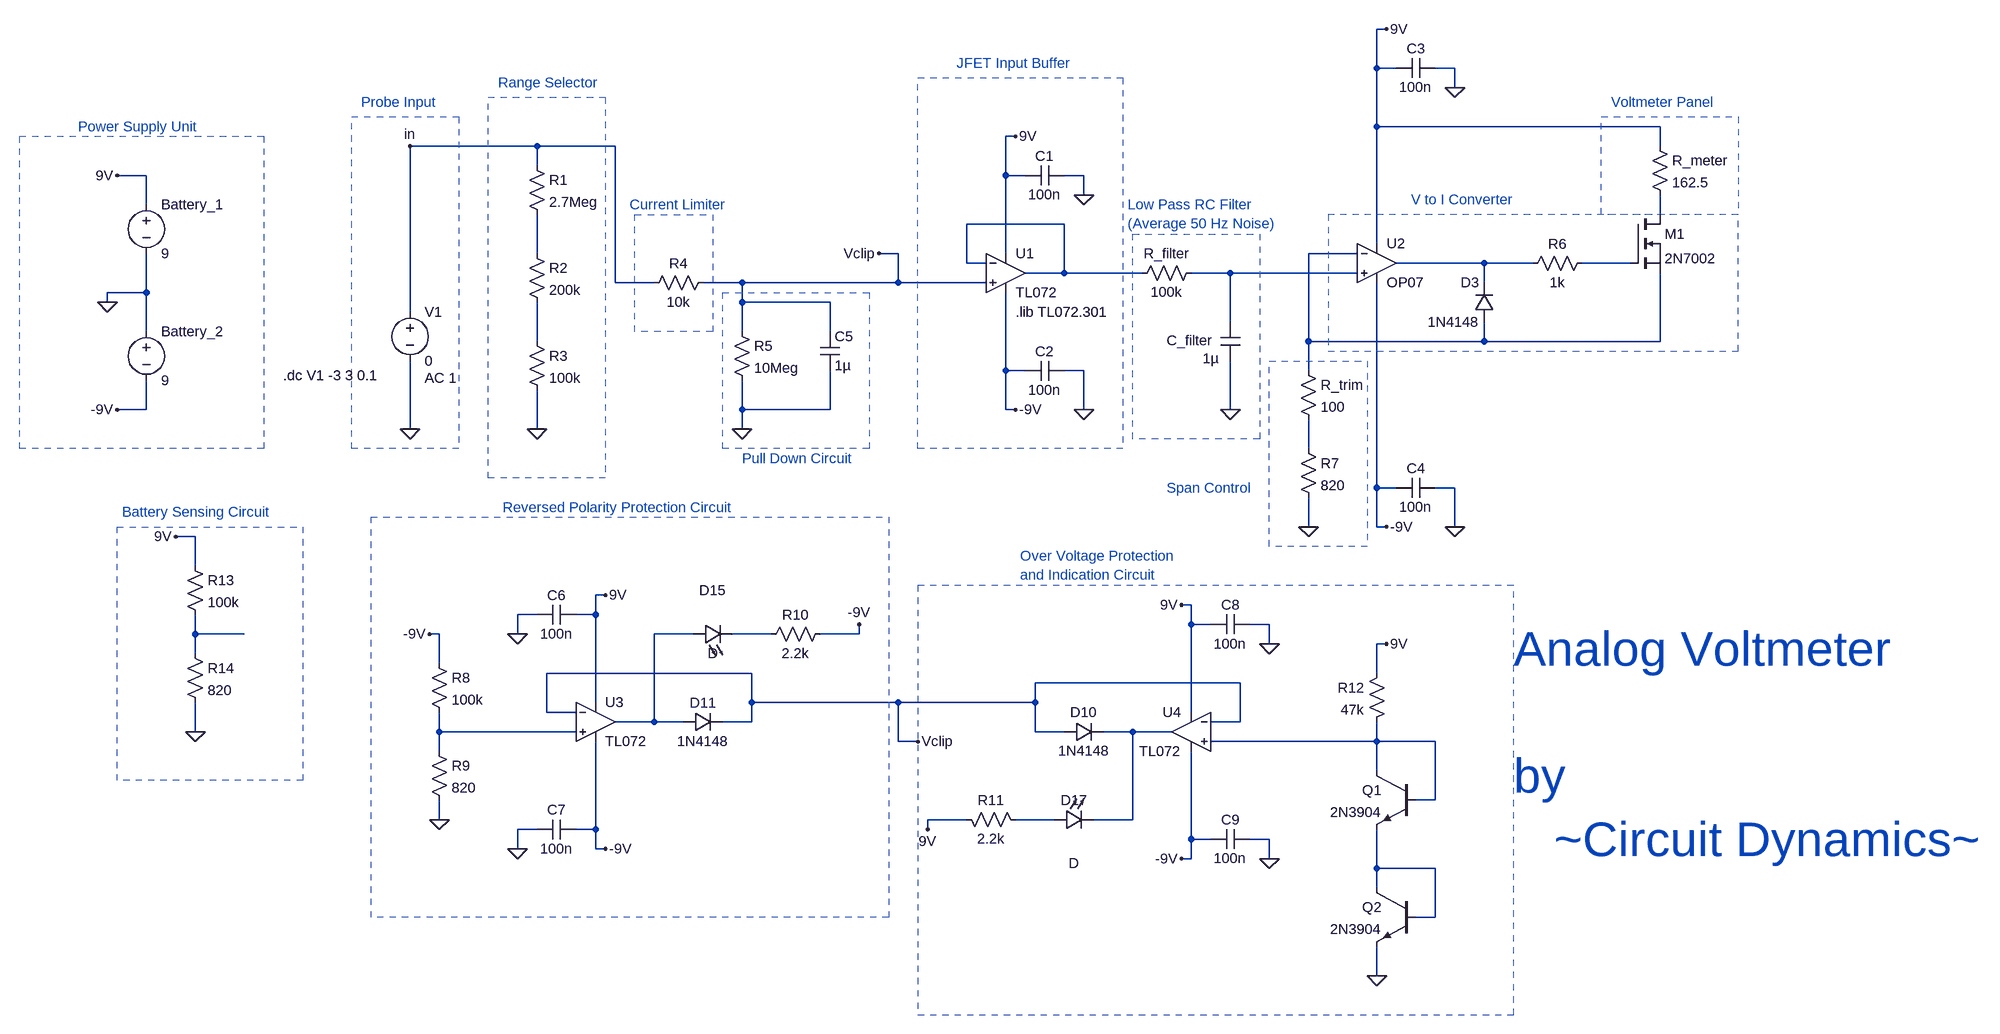
[diagram p0: schematic Analog_Voltmeter_Circuit.asc]
Analog_Voltmeter_Circuit.asc, the LTspice schematic file:
Version 4.1
SHEET 1 2912 2116
WIRE 1328 -272 1312 -272
WIRE 1312 -208 1312 -272
WIRE 1344 -208 1312 -208
WIRE 1440 -208 1408 -208
WIRE 1440 -176 1440 -208
WIRE 1312 -112 1312 -208
WIRE 1776 -112 1312 -112
WIRE 720 -96 704 -96
WIRE -64 -80 -272 -80
WIRE 64 -80 -64 -80
WIRE 1776 -80 1776 -112
WIRE -64 -48 -64 -80
WIRE -704 -32 -752 -32
WIRE 704 -32 704 -96
WIRE 736 -32 704 -32
WIRE 832 -32 800 -32
WIRE 832 0 832 -32
WIRE -704 16 -704 -32
WIRE 1776 32 1776 0
WIRE 800 48 640 48
WIRE 1312 80 1312 -112
WIRE -64 96 -64 32
WIRE 528 96 496 96
WIRE 704 96 704 -32
WIRE 1280 96 1200 96
WIRE 640 112 640 48
WIRE 672 112 640 112
WIRE 1488 112 1344 112
WIRE 1568 112 1488 112
WIRE 1728 112 1648 112
WIRE 800 128 800 48
WIRE 800 128 736 128
WIRE 928 128 800 128
WIRE 1072 128 1008 128
WIRE 1280 128 1072 128
WIRE 64 144 64 -80
WIRE 128 144 64 144
WIRE 272 144 208 144
WIRE 528 144 528 96
WIRE 528 144 272 144
WIRE 672 144 528 144
WIRE 1488 144 1488 112
WIRE -704 160 -704 96
WIRE -704 160 -768 160
WIRE -768 176 -768 160
WIRE 272 176 272 144
WIRE 416 176 272 176
WIRE -272 192 -272 -80
WIRE 1072 208 1072 128
WIRE -704 224 -704 160
WIRE 272 224 272 176
WIRE 416 224 416 176
WIRE -64 240 -64 176
WIRE 1200 240 1200 96
WIRE 1488 240 1488 208
WIRE 1488 240 1200 240
WIRE 1776 240 1776 128
WIRE 1776 240 1488 240
WIRE 704 288 704 160
WIRE 736 288 704 288
WIRE 832 288 800 288
WIRE 1200 288 1200 240
WIRE -704 352 -704 304
WIRE -704 352 -752 352
WIRE 272 352 272 304
WIRE 416 352 416 288
WIRE 416 352 272 352
WIRE 704 352 704 288
WIRE 720 352 704 352
WIRE 832 352 832 288
WIRE 1072 352 1072 272
WIRE -272 384 -272 272
WIRE -64 384 -64 320
WIRE 272 384 272 352
WIRE 1200 416 1200 368
WIRE 1312 480 1312 144
WIRE 1344 480 1312 480
WIRE 1440 480 1408 480
WIRE 1200 544 1200 496
WIRE 1312 544 1312 480
WIRE 1328 544 1312 544
WIRE 1440 544 1440 480
WIRE -624 560 -656 560
WIRE -624 608 -624 560
WIRE 48 656 32 656
WIRE 1008 672 992 672
WIRE -64 688 -96 688
WIRE 32 688 32 656
WIRE 32 688 0 688
WIRE 1008 704 1008 672
WIRE 1040 704 1008 704
WIRE 1136 704 1104 704
WIRE -624 720 -624 688
WIRE -544 720 -624 720
WIRE -224 720 -240 720
WIRE -96 720 -96 688
WIRE 192 720 128 720
WIRE 320 720 256 720
WIRE 464 720 464 704
WIRE 464 720 400 720
WIRE 1136 736 1136 704
WIRE 1328 736 1312 736
WIRE -624 752 -624 720
WIRE -224 768 -224 720
WIRE 288 784 -48 784
WIRE 1312 784 1312 736
WIRE 1088 800 752 800
WIRE 32 832 32 688
WIRE 288 832 288 784
WIRE 528 832 288 832
WIRE 752 832 752 800
WIRE 752 832 528 832
WIRE -48 848 -48 784
WIRE 0 848 -48 848
WIRE 1008 848 1008 704
WIRE 128 864 128 720
WIRE 128 864 64 864
WIRE 176 864 128 864
WIRE 288 864 288 832
WIRE 288 864 240 864
WIRE 1088 864 1088 800
WIRE 1088 864 1040 864
WIRE -624 880 -624 832
WIRE -224 880 -224 848
WIRE 0 880 -224 880
WIRE 752 880 752 832
WIRE 800 880 752 880
WIRE 912 880 864 880
WIRE 976 880 912 880
WIRE 528 896 528 832
WIRE 560 896 528 896
WIRE 1312 896 1312 864
WIRE 1312 896 1040 896
WIRE 1408 896 1312 896
WIRE -224 912 -224 880
WIRE 1312 944 1312 896
WIRE 1408 992 1408 896
WIRE 1408 992 1376 992
WIRE -224 1024 -224 992
WIRE 640 1024 576 1024
WIRE 784 1024 720 1024
WIRE 912 1024 912 880
WIRE 912 1024 848 1024
WIRE -64 1040 -96 1040
WIRE 32 1040 32 896
WIRE 32 1040 0 1040
WIRE 576 1040 576 1024
WIRE 1008 1056 1008 912
WIRE 1040 1056 1008 1056
WIRE 1136 1056 1104 1056
WIRE -96 1072 -96 1040
WIRE 32 1072 32 1040
WIRE 48 1072 32 1072
WIRE 1008 1088 1008 1056
WIRE 1008 1088 992 1088
WIRE 1136 1088 1136 1056
WIRE 1312 1104 1312 1040
WIRE 1408 1104 1312 1104
WIRE 1312 1136 1312 1104
WIRE 1408 1184 1408 1104
WIRE 1408 1184 1376 1184
WIRE 1312 1280 1312 1232
FLAG -64 384 0
FLAG -272 384 0
FLAG -768 176 0
FLAG -752 -32 9V
FLAG -752 352 -9V
FLAG 720 -96 9V
FLAG 720 352 -9V
FLAG 1328 -272 9V
FLAG 1328 544 -9V
FLAG 1072 352 0
FLAG 832 0 0
FLAG 832 352 0
FLAG 1440 -176 0
FLAG 1440 544 0
FLAG 272 384 0
FLAG 1200 544 0
FLAG -224 1024 0
FLAG 48 656 9V
FLAG 992 1088 -9V
FLAG 48 1072 -9V
FLAG 992 672 9V
FLAG 1312 1280 0
FLAG 1328 736 9V
FLAG 496 96 Vclip
FLAG 560 896 Vclip
FLAG -240 720 -9V
FLAG -96 720 0
FLAG 464 704 -9V
FLAG -96 1072 0
FLAG 1136 736 0
FLAG 1136 1088 0
FLAG 576 1040 9V
FLAG -272 -80 in
FLAG -624 880 0
FLAG -656 560 9V
SYMBOL voltage -272 176 R0
WINDOW 123 24 124 Left 2
WINDOW 39 0 0 Left 0
SYMATTR Value2 AC 1
SYMATTR InstName V1
SYMATTR Value 0
SYMBOL res -80 -64 R0
SYMATTR InstName R1
SYMATTR Value 2.7Meg
SYMATTR SpiceLine tol=10
SYMBOL res -80 80 R0
SYMATTR InstName R2
SYMATTR Value 200k
SYMATTR SpiceLine tol=10
SYMBOL res -80 224 R0
SYMATTR InstName R3
SYMATTR Value 100k
SYMATTR SpiceLine tol=10
SYMBOL voltage -704 0 R0
WINDOW 123 0 0 Left 0
WINDOW 39 0 0 Left 0
SYMATTR InstName Battery_1
SYMATTR Value 9
SYMBOL voltage -704 208 R0
WINDOW 123 0 0 Left 0
WINDOW 39 0 0 Left 0
SYMATTR InstName Battery_2
SYMATTR Value 9
SYMBOL res 224 128 R90
WINDOW 0 0 56 VBottom 2
WINDOW 3 32 56 VTop 2
SYMATTR InstName R4
SYMATTR Value 10k
SYMATTR SpiceLine tol=10
SYMBOL res 1184 400 R0
SYMATTR InstName R7
SYMATTR Value 820
SYMATTR SpiceLine tol=10
SYMBOL cap 1056 208 R0
WINDOW 0 -12 31 Right 2
WINDOW 3 -29 60 Left 2
SYMATTR InstName C_filter
SYMATTR Value 1µ
SYMBOL res 1024 112 R90
WINDOW 0 0 56 VBottom 2
WINDOW 3 32 56 VTop 2
SYMATTR InstName R_filter
SYMATTR Value 100k
SYMATTR SpiceLine tol=10
SYMBOL cap 800 -48 R90
WINDOW 0 0 32 VBottom 2
WINDOW 3 32 32 VTop 2
SYMATTR InstName C1
SYMATTR Value 100n
SYMBOL cap 800 272 R90
WINDOW 0 0 32 VBottom 2
WINDOW 3 32 32 VTop 2
SYMATTR InstName C2
SYMATTR Value 100n
SYMBOL cap 1408 -224 R90
WINDOW 0 0 32 VBottom 2
WINDOW 3 32 32 VTop 2
SYMATTR InstName C3
SYMATTR Value 100n
SYMBOL cap 1408 464 R90
WINDOW 0 0 32 VBottom 2
WINDOW 3 32 32 VTop 2
SYMATTR InstName C4
SYMATTR Value 100n
SYMBOL diode 1504 208 R180
WINDOW 0 24 64 Left 2
WINDOW 3 24 0 Left 2
SYMATTR InstName D3
SYMATTR Value 1N4148
SYMBOL res 256 208 R0
SYMATTR InstName R5
SYMATTR Value 10Meg
SYMATTR SpiceLine tol=10
SYMBOL nmos 1728 32 R0
SYMATTR InstName M1
SYMATTR Value 2N7002
SYMBOL res 1664 96 R90
WINDOW 0 0 56 VBottom 2
WINDOW 3 32 56 VTop 2
SYMATTR InstName R6
SYMATTR Value 1k
SYMATTR SpiceLine tol=10
SYMBOL res 1760 -96 R0
SYMATTR InstName R_meter
SYMATTR Value 162.5
SYMATTR SpiceLine tol=10
SYMBOL OpAmps\\opamp2 704 64 R0
SYMATTR InstName U1
SYMATTR Value TL072
SYMBOL OpAmps\\OP07 1312 48 R0
SYMATTR InstName U2
SYMBOL res 1184 272 R0
SYMATTR InstName R_trim
SYMATTR Value 100
SYMATTR SpiceLine tol=10
SYMBOL diode 800 864 M90
WINDOW 0 0 32 VBottom 2
WINDOW 3 32 32 VTop 2
SYMATTR InstName D10
SYMATTR Value 1N4148
SYMBOL diode 176 880 R270
WINDOW 0 32 32 VTop 2
WINDOW 3 0 32 VBottom 2
SYMATTR InstName D11
SYMATTR Value 1N4148
SYMBOL npn 1376 944 M0
SYMATTR InstName Q1
SYMATTR Value 2N3904
SYMBOL npn 1376 1136 M0
SYMATTR InstName Q2
SYMATTR Value 2N3904
SYMBOL res 1328 768 M0
SYMATTR InstName R12
SYMATTR Value 47k
SYMATTR SpiceLine tol=10
SYMBOL LED 192 736 R270
WINDOW 0 72 32 VTop 2
WINDOW 3 0 32 VBottom 2
SYMATTR InstName D15
SYMBOL res 304 736 R270
WINDOW 0 32 56 VTop 2
WINDOW 3 0 56 VBottom 2
SYMATTR InstName R10
SYMATTR Value 2.2k
SYMATTR SpiceLine tol=10
SYMBOL LED 784 1008 M90
WINDOW 0 0 32 VBottom 2
WINDOW 3 72 32 VTop 2
SYMATTR InstName D17
SYMBOL res -240 752 R0
SYMATTR InstName R8
SYMATTR Value 100k
SYMATTR SpiceLine tol=10
SYMBOL res -240 896 R0
SYMATTR InstName R9
SYMATTR Value 820
SYMATTR SpiceLine tol=10
SYMBOL cap 400 224 R0
SYMATTR InstName C5
SYMATTR Value 1µ
SYMBOL cap 0 672 R90
WINDOW 0 0 32 VBottom 2
WINDOW 3 32 32 VTop 2
SYMATTR InstName C6
SYMATTR Value 100n
SYMBOL cap 0 1024 R90
WINDOW 0 0 32 VBottom 2
WINDOW 3 32 32 VTop 2
SYMATTR InstName C7
SYMATTR Value 100n
SYMBOL cap 1040 688 M90
WINDOW 0 0 32 VBottom 2
WINDOW 3 32 32 VTop 2
SYMATTR InstName C8
SYMATTR Value 100n
SYMBOL cap 1040 1040 M90
WINDOW 0 0 32 VBottom 2
WINDOW 3 32 32 VTop 2
SYMATTR InstName C9
SYMATTR Value 100n
SYMBOL res 736 1040 M270
WINDOW 0 32 56 VTop 2
WINDOW 3 0 56 VBottom 2
SYMATTR InstName R11
SYMATTR Value 2.2k
SYMATTR SpiceLine tol=10
SYMBOL OpAmps\\opamp2 32 800 R0
SYMATTR InstName U3
SYMATTR Value TL072
SYMBOL OpAmps\\opamp2 1008 816 M0
SYMATTR InstName U4
SYMATTR Value TL072
SYMBOL res -640 592 R0
SYMATTR InstName R13
SYMATTR Value 100k
SYMATTR SpiceLine tol=1
SYMBOL res -640 736 R0
SYMATTR InstName R14
SYMATTR Value 820
SYMATTR SpiceLine tol=1
TEXT -480 296 Left 2 !.dc V1 -3 3 0.1
TEXT 720 192 Left 2 !.lib TL072.301
TEXT -744 520 Left 2 ;Battery Sensing Circuit
TEXT -816 -112 Left 2 ;Power Supply Unit
TEXT -128 -184 Left 2 ;Range Selector
TEXT -352 -152 Left 2 ;Probe Input
TEXT 88 16 Left 2 ;Current Limiter
TEXT 272 432 Left 2 ;Pull Down Circuit
TEXT 624 -216 Left 2 ;JFET Input Buffer
TEXT 904 16 Left 2 ;Low Pass RC Filter\n(Average 50 Hz Noise)
TEXT 968 480 Left 2 ;Span Control
TEXT 1696 -152 Left 2 ;Voltmeter Panel
TEXT 1368 8 Left 2 ;V to I Converter
TEXT -120 512 Left 2 ;Reversed Polarity Protection Circuit
TEXT 728 592 Left 2 ;Over Voltage Protection \nand Indication Circuit
TEXT 1536 744 Left 6 ;Analog Voltmeter\n \nby\n   ~Circuit Dynamics~
RECTANGLE Normal -448 960 -752 544 2
RECTANGLE Normal 512 1184 -336 528 2
RECTANGLE Normal 1536 640 560 1344 2
RECTANGLE Normal -512 416 -912 -96 2
RECTANGLE Normal 48 464 -144 -160 2
RECTANGLE Normal 224 224 96 32 2
RECTANGLE Normal 240 160 480 416 2
RECTANGLE Normal 896 416 560 -192 2
RECTANGLE Normal 912 64 1120 400 2
RECTANGLE Normal 1296 576 1136 272 2
RECTANGLE Normal 1904 32 1680 -128 2
RECTANGLE Normal 1232 256 1904 32 2
RECTANGLE Normal -368 -128 -192 416 2

The netlist it stands for:
* Analog_Voltmeter_Circuit.asc
V1 in 0 0 AC 1
R1 in N003 2.7Meg tol=10
R2 N003 N008 200k tol=10
R3 N008 0 100k tol=10
V§Battery_1 9V 0 9
V§Battery_2 0 -9V 9
R4 Vclip in 10k tol=10
R7 N009 0 820 tol=10
C_filter N007 0 1µ
R_filter N007 N002 100k tol=10
C1 0 9V 100n
C2 0 -9V 100n
C3 0 9V 100n
C4 0 -9V 100n
D3 N004 N005 1N4148
R5 Vclip 0 10Meg tol=10
M1 N001 N006 N004 N004 2N7002
R6 N006 N005 1k tol=10
R_meter 9V N001 162.5 tol=10
X§U1 Vclip N002 9V -9V N002 TL072  ; pins In+ In- V+ V- OUT
X§U2 N007 N004 9V -9V N005 LT1001  ; OP07, pins In+ In- V+ V- OUT
R_trim N004 N009 100 tol=10
D10 Vclip N014 1N4148
D11 N011 Vclip 1N4148
Q1 N015 N015 N017 0 2N3904
Q2 N017 N017 0 0 2N3904
R12 9V N015 47k tol=10
D15 N011 N012 D
R10 N012 -9V 2.2k tol=10
D17 N016 N014 D
R8 -9V N013 100k tol=10
R9 N013 0 820 tol=10
C5 Vclip 0 1µ
C6 9V 0 100n
C7 -9V 0 100n
C8 9V 0 100n
C9 -9V 0 100n
R11 N016 9V 2.2k tol=10
X§U3 N013 Vclip 9V -9V N011 TL072  ; pins In+ In- V+ V- OUT
X§U4 N015 Vclip 9V -9V N014 TL072  ; pins In+ In- V+ V- OUT
R13 9V N010 100k tol=1
R14 N010 0 820 tol=1
.model D D
.lib standard.dio
.model NPN NPN
.model PNP PNP
.lib standard.bjt
.model NMOS NMOS
.model PMOS PMOS
.lib standard.mos
.dc V1 -3 3 0.1
.lib TL072.301
* Battery Sensing Circuit
* Power Supply Unit
* Range Selector
* Probe Input
* Current Limiter
* Pull Down Circuit
* JFET Input Buffer
* Low Pass RC Filter
* (Average 50 Hz Noise)
* Span Control
* Voltmeter Panel
* V to I Converter
* Reversed Polarity Protection Circuit
* Over Voltage Protection
* and Indication Circuit
* Analog Voltmeter
* by
*    ~Circuit Dynamics~
.lib LTC.lib
.backanno
.end